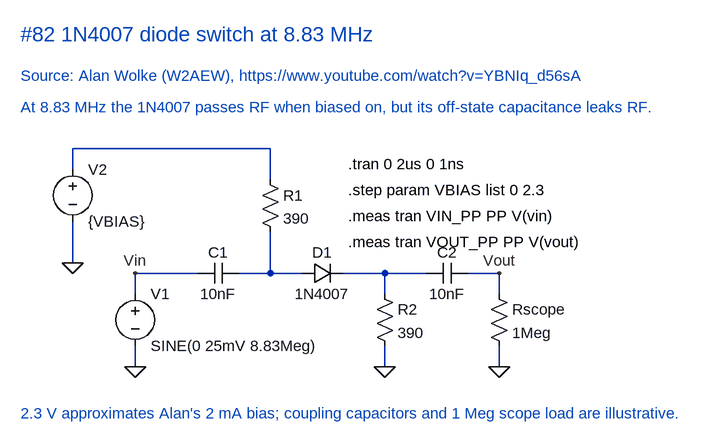
[diagram p0: schematic 1N4007 8.83 MHz comparison.asc]
1N4007 8.83 MHz comparison.asc, the LTspice schematic file:
Version 4.1
SHEET 1 1020 680
WIRE 352 -192 48 -192
WIRE 48 -160 48 -192
WIRE 352 -144 352 -192
WIRE 48 -48 48 -80
WIRE 240 0 144 0
WIRE 352 0 352 -64
WIRE 352 0 304 0
WIRE 400 0 352 0
WIRE 528 0 464 0
WIRE 592 0 528 0
WIRE 704 0 656 0
WIRE 704 32 704 0
WIRE 704 144 704 112
WIRE 144 32 144 0
WIRE 528 32 528 0
WIRE 144 144 144 112
WIRE 528 144 528 112
FLAG 144 144 0
WIRE 48 -16 48 -48
FLAG 48 -16 0
FLAG 528 144 0
FLAG 704 0 Vout
FLAG 704 144 0
FLAG 144 0 Vin
SYMBOL voltage 144 16 R0
WINDOW 123 0 0 Left 0
WINDOW 39 0 0 Left 0
SYMATTR InstName V1
SYMATTR Value SINE(0 25mV 8.83Meg)
SYMBOL diode 400 16 R270
WINDOW 0 32 32 VTop 2
WINDOW 3 0 32 VBottom 2
SYMATTR InstName D1
SYMATTR Value 1N4007
SYMBOL cap 304 -16 R90
WINDOW 0 0 32 VBottom 2
WINDOW 3 32 32 VTop 2
SYMATTR InstName C1
SYMATTR Value 10nF
SYMBOL res 336 -160 R0
SYMATTR InstName R1
SYMATTR Value 390
SYMBOL voltage 48 -176 R0
WINDOW 123 0 0 Left 0
WINDOW 39 0 0 Left 0
SYMATTR InstName V2
SYMATTR Value {VBIAS}
SYMBOL res 512 16 R0
SYMATTR InstName R2
SYMATTR Value 390
SYMBOL cap 656 -16 R90
WINDOW 0 0 32 VBottom 2
WINDOW 3 32 32 VTop 2
SYMATTR InstName C2
SYMATTR Value 10nF
SYMBOL res 688 16 R0
SYMATTR InstName Rscope
SYMATTR Value 1Meg
TEXT 472 -168 Left 2 !.tran 0 2us 0 1ns
TEXT 472 -128 Left 2 !.step param VBIAS list 0 2.3
TEXT 472 -88 Left 2 !.meas tran VIN_PP PP V(vin)
TEXT 472 -48 Left 2 !.meas tran VOUT_PP PP V(vout)
TEXT -32 -368 Left 3 ;#82 1N4007 diode switch at 8.83 MHz
TEXT -32 -304 Left 2 ;Source: Alan Wolke (W2AEW), https://www.youtube.com/watch?v=YBNIq_d56sA
TEXT -32 -256 Left 2 ;At 8.83 MHz the 1N4007 passes RF when biased on, but its off-state capacitance leaks RF.
TEXT -32 216 Left 2 ;2.3 V approximates Alan's 2 mA bias; coupling capacitors and 1 Meg scope load are illustrative.

The netlist it stands for:
* 1N4007 8.83 MHz comparison.asc
V1 Vin 0 SINE(0 25mV 8.83Meg)
D1 N002 N003 1N4007
C1 N002 Vin 10nF
R1 N001 N002 390
V2 N001 0 {VBIAS}
R2 N003 0 390
C2 Vout N003 10nF
Rscope Vout 0 1Meg
.model D D
.lib standard.dio
.tran 0 2us 0 1ns
.step param VBIAS list 0 2.3
.meas tran VIN_PP PP V(vin)
.meas tran VOUT_PP PP V(vout)
* #82 1N4007 diode switch at 8.83 MHz
* Source: Alan Wolke (W2AEW), https://www.youtube.com/watch?v=YBNIq_d56sA
* At 8.83 MHz the 1N4007 passes RF when biased on, but its off-state capacitance leaks RF.
* 2.3 V approximates Alan's 2 mA bias; coupling capacitors and 1 Meg scope load are illustrative.
.backanno
.end